# Altium schematic sheet 05-CPUPHY QCMI SOM.SchDoc: CPU PHY
size 431 x 279 mm; Designer: B. Jordan; DsnPath: G:\My Drive\Quilter Computer - Engineering Assets\NXP i.MX8M-Mini\8MMINILPD4-CPU2-DESIGNFILES\8MMINILPD4-CPU2-DESIGNFILES\SCH-47712_A4.DSN; Author: B. Jordan; DrawnBy: B. Jordan; Revision: 0; SheetNumber: 05; SheetTotal: 10; CHK_APP_DATE: --/--/--; DSN_APP_DATE: --/--/--; ENG_APP_DATE: --/--/--
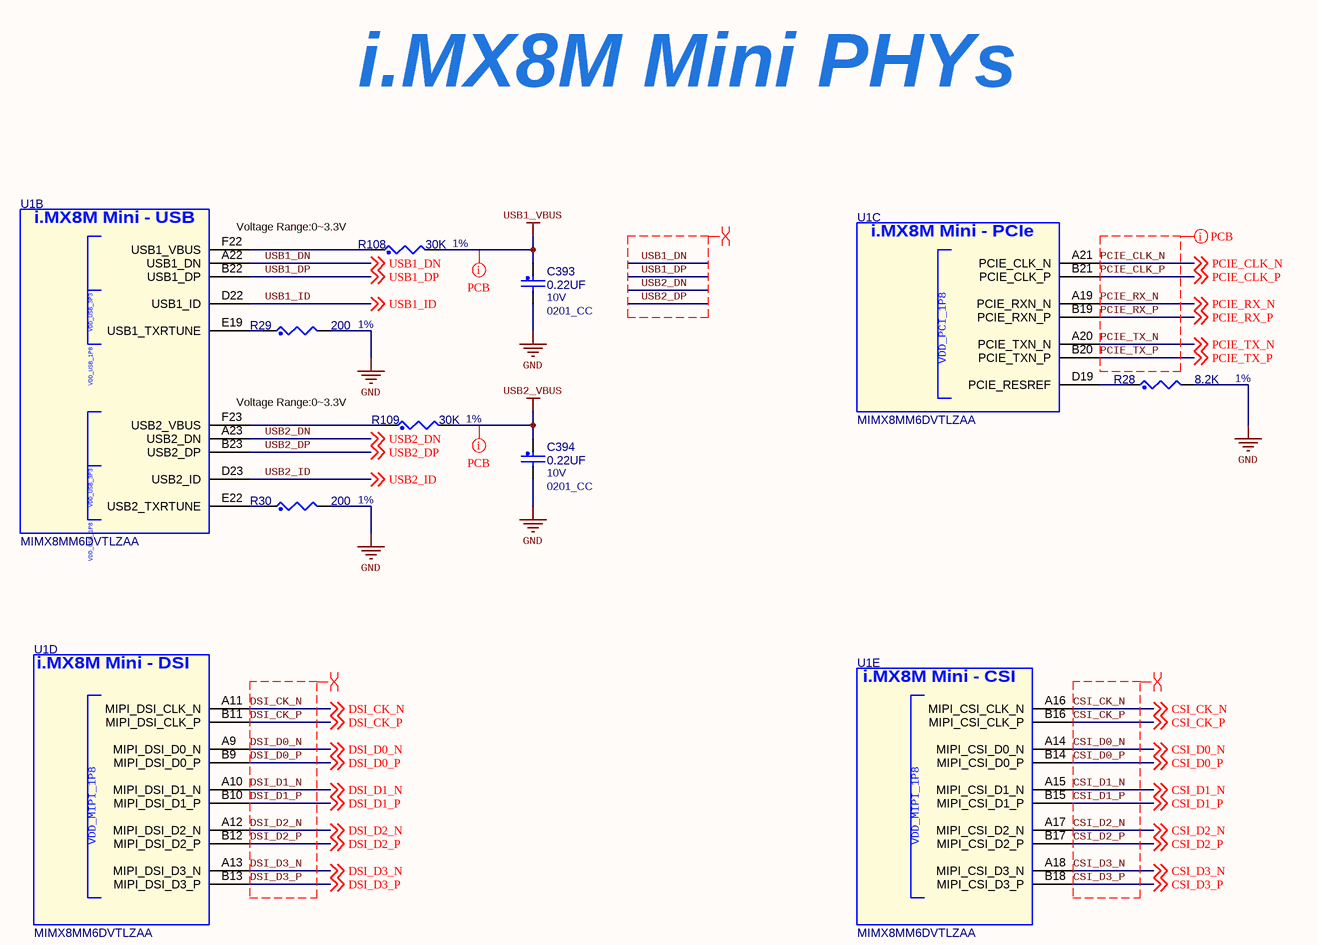
[diagram p0: 05-CPUPHY QCMI SOM.SchDoc]

## Parts
C393  0.22UF  VOLTAGE: 10V  [0201_CC]
C394  0.22UF  VOLTAGE: 10V  [0201_CC]
R28  8.2K  Tolerance: 1%  [0402_CC]
R29  200  Tolerance: 1%  [0201_CC]
R30  200  Tolerance: 1%  [0201_CC]
R108  30K  Tolerance: 1%  [0201_CC]
R109  30K  Tolerance: 1%  [0201_CC]
U1  MIMX8MM6DVTLZAA  [bga486_0p5_14x14]  (parts B,C,D,E of 14)

## Nets
GND: C393.2 C394.2 R28.2 R29.2 R30.2
USB1_VBUS: C393.1 R108.2
USB2_VBUS: C394.1 R109.2
CSI_CK_N: U1.A16(MIPI_CSI_CLK_N) ; off-sheet CSI_CK_N
CSI_CK_P: U1.B16(MIPI_CSI_CLK_P) ; off-sheet CSI_CK_P
CSI_D0_N: U1.A14(MIPI_CSI_D0_N) ; off-sheet CSI_D0_N
CSI_D0_P: U1.B14(MIPI_CSI_D0_P) ; off-sheet CSI_D0_P
CSI_D1_N: U1.A15(MIPI_CSI_D1_N) ; off-sheet CSI_D1_N
CSI_D1_P: U1.B15(MIPI_CSI_D1_P) ; off-sheet CSI_D1_P
CSI_D2_N: U1.A17(MIPI_CSI_D2_N) ; off-sheet CSI_D2_N
CSI_D2_P: U1.B17(MIPI_CSI_D2_P) ; off-sheet CSI_D2_P
CSI_D3_N: U1.A18(MIPI_CSI_D3_N) ; off-sheet CSI_D3_N
CSI_D3_P: U1.B18(MIPI_CSI_D3_P) ; off-sheet CSI_D3_P
DSI_CK_N: U1.A11(MIPI_DSI_CLK_N) ; off-sheet DSI_CK_N
DSI_CK_P: U1.B11(MIPI_DSI_CLK_P) ; off-sheet DSI_CK_P
DSI_D0_N: U1.A9(MIPI_DSI_D0_N) ; off-sheet DSI_D0_N
DSI_D0_P: U1.B9(MIPI_DSI_D0_P) ; off-sheet DSI_D0_P
DSI_D1_N: U1.A10(MIPI_DSI_D1_N) ; off-sheet DSI_D1_N
DSI_D1_P: U1.B10(MIPI_DSI_D1_P) ; off-sheet DSI_D1_P
DSI_D2_N: U1.A12(MIPI_DSI_D2_N) ; off-sheet DSI_D2_N
DSI_D2_P: U1.B12(MIPI_DSI_D2_P) ; off-sheet DSI_D2_P
DSI_D3_N: U1.A13(MIPI_DSI_D3_N) ; off-sheet DSI_D3_N
DSI_D3_P: U1.B13(MIPI_DSI_D3_P) ; off-sheet DSI_D3_P
PCIE_CLK_N: U1.A21(PCIE_CLK_N) ; off-sheet PCIE_CLK_N
PCIE_CLK_P: U1.B21(PCIE_CLK_P) ; off-sheet PCIE_CLK_P
PCIE_RX_N: U1.A19(PCIE_RXN_N) ; off-sheet PCIE_RX_N
PCIE_RX_P: U1.B19(PCIE_RXN_P) ; off-sheet PCIE_RX_P
PCIE_TX_N: U1.A20(PCIE_TXN_N) ; off-sheet PCIE_TX_N
PCIE_TX_P: U1.B20(PCIE_TXN_P) ; off-sheet PCIE_TX_P
USB1_DN: U1.A22(USB1_DN) ; off-sheet USB1_DN
USB1_DP: U1.B22(USB1_DP) ; off-sheet USB1_DP
USB1_ID: U1.D22(USB1_ID) ; off-sheet USB1_ID
USB2_DN: U1.A23(USB2_DN) ; off-sheet USB2_DN
USB2_DP: U1.B23(USB2_DP) ; off-sheet USB2_DP
USB2_ID: U1.D23(USB2_ID) ; off-sheet USB2_ID
NetR28_1: R28.1 U1.D19(PCIE_RESREF)
NetR29_1: R29.1 U1.E19(USB1_TXRTUNE)
NetR30_1: R30.1 U1.E22(USB2_TXRTUNE)
NetR108_1: R108.1 U1.F22(USB1_VBUS)
NetR109_1: R109.1 U1.F23(USB2_VBUS)

## Layout directives
differential pair; differential pair class CSI: CSI_CK_N, CSI_CK_P, CSI_D0_N, CSI_D0_P, CSI_D1_N, CSI_D1_P, CSI_D2_N, CSI_D2_P, CSI_D3_N, CSI_D3_P
differential pair; differential pair class USB: USB1_DN, USB1_DP, USB2_DN, USB2_DP
differential pair; differential pair class PCIE: PCIE_CLK_N, PCIE_CLK_P, PCIE_RX_N, PCIE_RX_P, PCIE_TX_N, PCIE_TX_P
rule Supply Nets [Voltage = 3.300]; net class POWER: USB1_VBUS, USB2_VBUS
differential pair; differential pair class DSI: DSI_CK_N, DSI_CK_P, DSI_D0_N, DSI_D0_P, DSI_D1_N, DSI_D1_P, DSI_D2_N, DSI_D2_P, DSI_D3_N, DSI_D3_P

## Notes on the sheet
- i.MX8M Mini PHYs
- Voltage Range:0~3.3V
- (near U1) Voltage Range:0~3.3V
- DWG. NO.
- REV.
- SHT.
- REVISION
- DESCRIPTION
- DATE
- APPROVED
- ENG:
- APPROVALS
- REFERENCE DOCUMENTS
- DSN:
- CHK:
- TITLE
- PROJECT
- BOM:
- ASSY DWG:
- FAB DWG:
- SIZE
- FILE NAME
- B
- SCHEMATIC DOCUMENT NUMBER
- SHEET
- OF
- REV
- PCB DWG:
- (in symbol MIMX8MM_BGA486P, part B) i.MX8M Mini - USB
- (in symbol MIMX8MM_BGA486P, part C) i.MX8M Mini - PCIe
- (in symbol MIMX8MM_BGA486P, part D) i.MX8M Mini - DSI
- (in symbol MIMX8MM_BGA486P, part E) i.MX8M Mini - CSI

## Library data of the parts
C393 C394 = CAP_NP: CAP CER 0.22UF 10V 20% X5R 0201; MFG_PN01: LMK063BJ224MP-F; MFG_NAME01: Taiyo Yuden; EIA Case: 0201; Value: 0.22UF; ROHS: Yes; Tolerance: 20%; PCB Footprint: 0201_CC
R28 = RES: RES MF 8.2K  1/10W 1% AEC-Q200 0402; MFG_NAME01: KOA SPEER; MFG_PN01: RK73H1ETTP8201F; EIA Case: 0402; Temp Range: -55°C ~ 155°C; Value: 8.2K; PCB Footprint: 0402_CC; ROHS: Yes; Rated Power: 1/10W
R29 R30 = RES: RES MF 200 OHM 1/20W 1% 0201; MFG_NAME01: YAGEO AMERICA; MFG_PN01: RC0201FR-07200RL; EIA Case: 0201; VOLTAGE: 25V; Temp Range: -55°C ~ 155°C; Value: 200; PCB Footprint: 0201_CC; ROHS: Yes; Rated Power: 1/20W
R108 = RES: RES MF 30K 1/20W 1% 0201; MFG_NAME01: YAGEO AMERICA; MFG_PN01: RC0201FR-0730KL; EIA Case: 0201; VOLTAGE: 25V; Temp Range: -55°C ~ 155°C; Value: 30K; PCB Footprint: 0201_CC; ROHS: Yes; Rated Power: 1/20W
R109 = RES: RES MF 30K 1/20W 1% 0201; MFG_PN01: RC0201FR-0730KL; MFG_NAME01: YAGEO AMERICA; EIA Case: 0201; VOLTAGE: 25V; Temp Range: -55°C ~ 155°C; Value: 30K; PCB Footprint: 0201_CC; ROHS: Yes; Rated Power: 1/20W
U1 = MIMX8MM_BGA486P: IC CPU QUAD CORTEX A53+M4 1.8GHZ BGA486; MFG_NAME01: NXP SEMICONDUCTORS; Value: MIMX8MM6DVTLZAA; MFG_PN01: MIMX8MM6DVTLZAA; ROHS: Yes; PCB Footprint: bga486_0p5_14x14; JEDEC Case: BGA486